# Altium schematic sheet Top_Sheet.SchDoc
size A4; DocumentNumber: 1; SheetNumber: 1; SheetTotal: 4
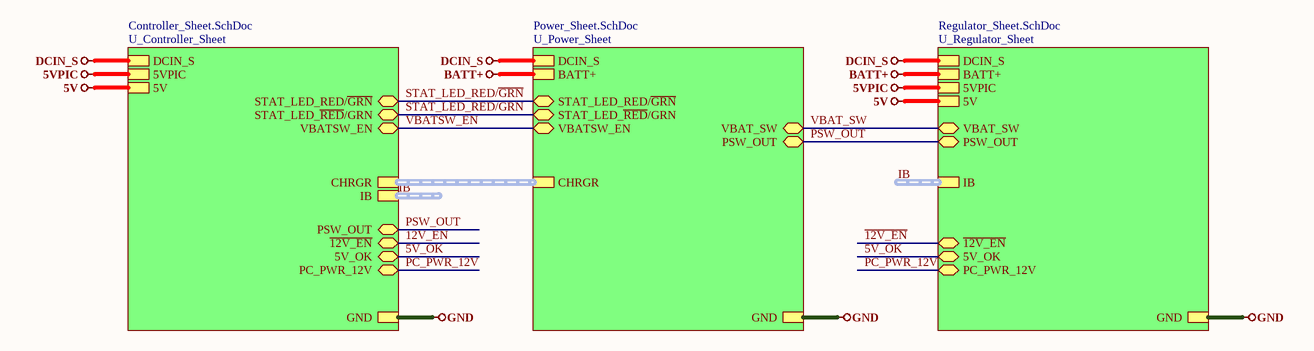
[diagram p0: Top_Sheet.SchDoc]

## Sub-sheets
U_Controller_Sheet = Controller_Sheet.SchDoc: STAT_LED_RED/~{GRN} (bidir), STAT_LED_~{RED}/GRN (bidir), PC_PWR_12V (bidir), 5V_OK (bidir), VBATSW_EN (bidir), IB (harness IB), CHRGR (harness CHRGR), GND, DCIN_S, 5VPIC, 5V, ~{12V_EN} (bidir), PSW_OUT (bidir)
U_Power_Sheet = Power_Sheet.SchDoc: GND, DCIN_S, BATT+, STAT_LED_RED/~{GRN} (bidir), STAT_LED_~{RED}/GRN (bidir), VBAT_SW (bidir), VBATSW_EN (bidir), CHRGR (harness CHRGR), PSW_OUT (bidir)
U_Regulator_Sheet = Regulator_Sheet.SchDoc: GND, DCIN_S, BATT+, VBAT_SW (bidir), 5VPIC, 5V, PSW_OUT (bidir), PC_PWR_12V (bidir), 5V_OK (bidir), IB (harness IB), ~{12V_EN} (bidir)

## Nets
5V: sheet U_Regulator_Sheet/5V, sheet U_Controller_Sheet/5V
5VPIC: sheet U_Regulator_Sheet/5VPIC, sheet U_Controller_Sheet/5VPIC
BATT+: sheet U_Power_Sheet/BATT+, sheet U_Regulator_Sheet/BATT+
DCIN_S: sheet U_Power_Sheet/DCIN_S, sheet U_Regulator_Sheet/DCIN_S, sheet U_Controller_Sheet/DCIN_S
GND: sheet U_Power_Sheet/GND, sheet U_Regulator_Sheet/GND, sheet U_Controller_Sheet/GND
~{12V_EN}: sheet U_Regulator_Sheet/~{12V_EN}, sheet U_Controller_Sheet/~{12V_EN}
5V_OK: sheet U_Regulator_Sheet/5V_OK, sheet U_Controller_Sheet/5V_OK
PC_PWR_12V: sheet U_Regulator_Sheet/PC_PWR_12V, sheet U_Controller_Sheet/PC_PWR_12V
PSW_OUT: sheet U_Power_Sheet/PSW_OUT, sheet U_Regulator_Sheet/PSW_OUT, sheet U_Controller_Sheet/PSW_OUT
STAT_LED_~{RED}/GRN: sheet U_Power_Sheet/STAT_LED_~{RED}/GRN, sheet U_Controller_Sheet/STAT_LED_~{RED}/GRN
STAT_LED_RED/~{GRN}: sheet U_Power_Sheet/STAT_LED_RED/~{GRN}, sheet U_Controller_Sheet/STAT_LED_RED/~{GRN}
VBAT_SW: sheet U_Power_Sheet/VBAT_SW, sheet U_Regulator_Sheet/VBAT_SW
VBATSW_EN: sheet U_Power_Sheet/VBATSW_EN, sheet U_Controller_Sheet/VBATSW_EN

## Buses and harness runs
harness IB = sheet U_Controller_Sheet/IB
harness IB = sheet U_Regulator_Sheet/IB
harness sheet U_Controller_Sheet/CHRGR = sheet U_Power_Sheet/CHRGR

## Notes on the sheet
- File:
- Title:
- Date:
- Page
- Num:
- Total:
- Drawn By: Huzaifa Ali